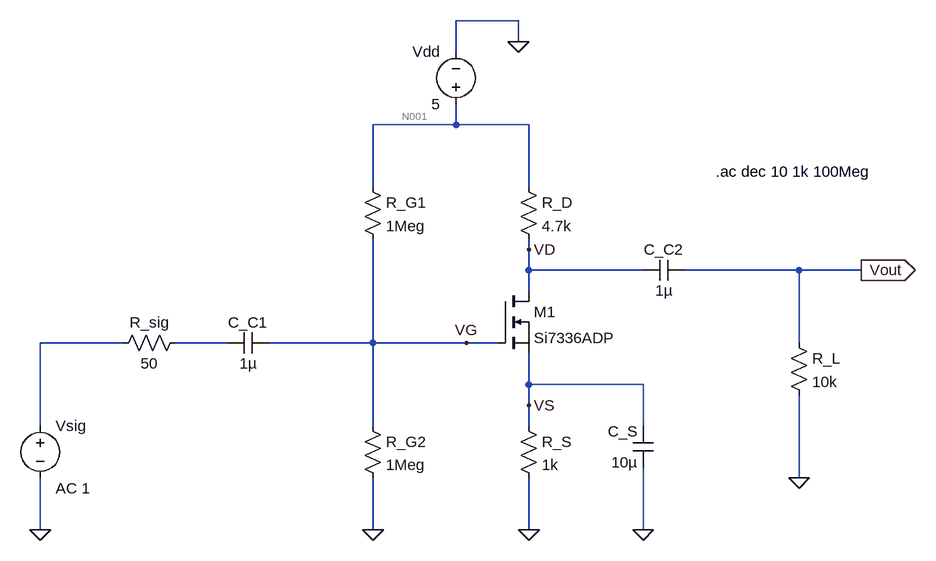
[diagram p0: schematic CommonSource.asc]
CommonSource.asc, the LTspice schematic file:
Version 4.1
SHEET 1 880 680
WIRE 208 -336 112 -336
WIRE 208 -304 208 -336
WIRE 112 -288 112 -336
WIRE 112 -176 112 -208
WIRE 112 -176 -16 -176
WIRE 224 -176 112 -176
WIRE -16 -80 -16 -176
WIRE 224 -80 224 -176
WIRE 224 16 224 0
WIRE 224 48 224 16
WIRE 400 48 224 48
WIRE 640 48 464 48
WIRE 736 48 640 48
WIRE 224 80 224 48
WIRE -400 160 -528 160
WIRE -240 160 -320 160
WIRE -16 160 -16 0
WIRE -16 160 -176 160
WIRE 128 160 -16 160
WIRE 176 160 128 160
WIRE 640 160 640 48
WIRE 224 224 224 176
WIRE 400 224 224 224
WIRE 224 256 224 224
WIRE -528 288 -528 160
WIRE -16 288 -16 160
WIRE 224 288 224 256
WIRE 400 288 400 224
WIRE 640 368 640 240
WIRE -528 448 -528 368
WIRE -16 448 -16 368
WIRE 224 448 224 368
WIRE 400 448 400 352
FLAG -528 448 0
FLAG -16 448 0
FLAG 224 448 0
FLAG 400 448 0
FLAG 640 368 0
FLAG 208 -304 0
FLAG 736 48 Vout
IOPIN 736 48 Out
FLAG 224 16 VD
FLAG 224 256 VS
FLAG 128 160 VG
SYMBOL nmos 176 80 R0
SYMATTR InstName M1
SYMATTR Value Si7336ADP
SYMBOL res 208 -96 R0
SYMATTR InstName R_D
SYMATTR Value 4.7k
SYMBOL res 208 272 R0
SYMATTR InstName R_S
SYMATTR Value 1k
SYMBOL res -32 -96 R0
SYMATTR InstName R_G1
SYMATTR Value 1Meg
SYMBOL res -32 272 R0
SYMATTR InstName R_G2
SYMATTR Value 1Meg
SYMBOL cap 464 32 R90
WINDOW 0 0 32 VBottom 2
WINDOW 3 32 32 VTop 2
SYMATTR InstName C_C2
SYMATTR Value 1µ
SYMBOL cap 416 352 R180
WINDOW 0 24 56 Left 2
WINDOW 3 24 8 Left 2
SYMATTR InstName C_S
SYMATTR Value 10µ
SYMBOL cap -176 144 R90
WINDOW 0 0 32 VBottom 2
WINDOW 3 32 32 VTop 2
SYMATTR InstName C_C1
SYMATTR Value 1µ
SYMBOL res -304 144 R90
WINDOW 0 0 56 VBottom 2
WINDOW 3 32 56 VTop 2
SYMATTR InstName R_sig
SYMATTR Value 50
SYMBOL voltage -528 272 R0
WINDOW 123 24 112 Left 2
WINDOW 39 0 0 Left 0
SYMATTR Value2 AC 1
SYMATTR InstName Vsig
SYMATTR Value ""
SYMBOL res 624 144 R0
SYMATTR InstName R_L
SYMATTR Value 10k
SYMBOL voltage 112 -192 R180
WINDOW 0 24 96 Left 2
WINDOW 3 24 16 Left 2
SYMATTR InstName Vdd
SYMATTR Value 5
TEXT 512 -104 Left 2 !.ac dec 10 1k 100Meg

The netlist it stands for:
* CommonSource.asc
M1 VD VG VS VS Si7336ADP
R_D N001 VD 4.7k
R_S VS 0 1k
R_G1 N001 VG 1Meg
R_G2 VG 0 1Meg
C_C2 Vout VD 1µ
C_S 0 VS 10µ
C_C1 VG N003 1µ
R_sig N003 N002 50
Vsig N002 0 AC 1
R_L Vout 0 10k
Vdd N001 0 5
.model NMOS NMOS
.model PMOS PMOS
.lib standard.mos
.ac dec 10 1k 100Meg
.backanno
.end

* Results of the author's LTspice run, read from the files saved beside the schematic
* Operating Point, zero values left out:
*   V(n001) = 5 V
*   V(vd) = 4.594 V
*   V(vg) = 2.5 V
*   V(vs) = 86.44 mV
*   I(R_D) = 86.44 µA
*   I(R_G1) = 2.5 µA
*   I(R_G2) = 2.5 µA
*   I(R_S) = 86.44 µA
*   I(Vdd) = -88.94 µA
*   Id(M1) = 86.44 µA
*   Ig(M1) = -367.9 pA
*   Is(M1) = -86.44 µA
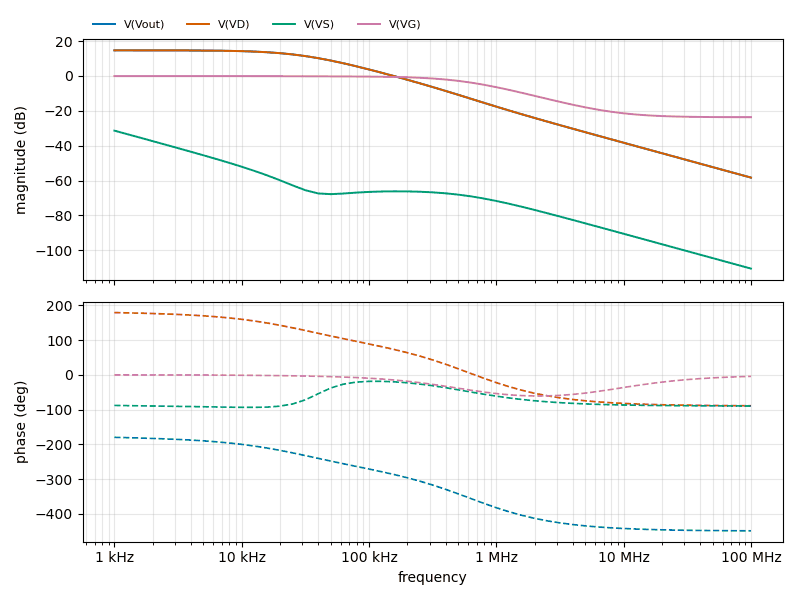
[diagram p1: AC Analysis of CommonSource.asc, plotted from the saved traces]
* AC Analysis, 1 run:
*   V(Vout): 14.71 dB at 1 kHz, -58.31 dB at 100 MHz, peak 14.71 dB at 1 kHz, 3 dB below the peak at 29.59 kHz
*   V(VD): 14.72 dB at 1 kHz, -58.31 dB at 100 MHz, peak 14.72 dB at 1 kHz, 3 dB below the peak at 29.58 kHz
*   V(VS): -31.35 dB at 1 kHz, -110.53 dB at 100 MHz, peak -31.35 dB at 1 kHz, 3 dB below the peak at 1.414 kHz
*   V(VG): -0.07 dB at 1 kHz, -23.65 dB at 100 MHz, peak -0.07 dB at 1 kHz, 3 dB below the peak at 536.3 kHz